# Altium schematic sheet Sensor_Section2.SchDoc
size A
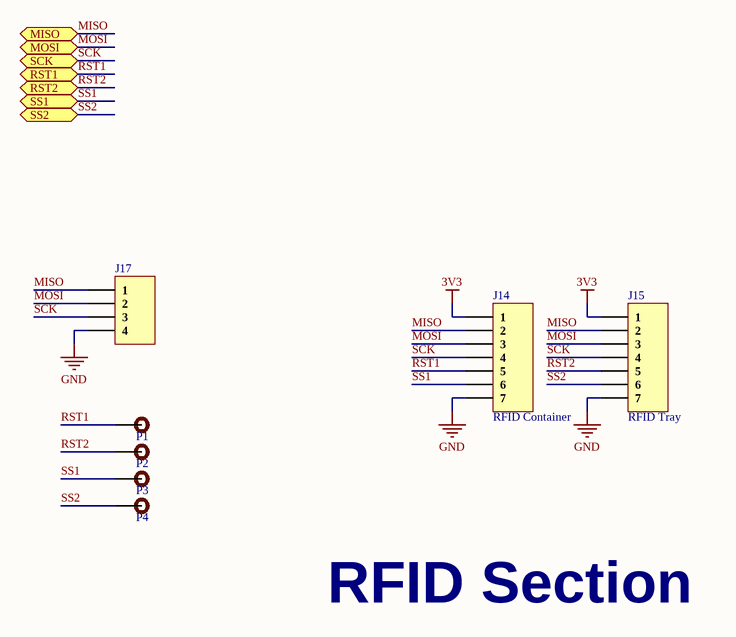
[diagram p0: Sensor_Section2.SchDoc]

## Parts
J14  RFID Container  [B7B-XH-A(LF)(SN)]
J15  RFID Tray  [B7B-XH-A(LF)(SN)]
J17  B4B-XH-A(LF)(SN)  [B4B-XH-A(LF)(SN)]  (value not drawn)
P1  Test Point  [Test point]  (value not drawn)
P2  Test Point  [Test point]  (value not drawn)
P3  Test Point  [Test point]  (value not drawn)
P4  Test Point  [Test point]  (value not drawn)

## Ports
MISO (bidir), MOSI (bidir), RST1 (bidir), RST2 (bidir), SCK (bidir), SS1 (bidir), SS2 (bidir)

## Nets
3V3: J14.1 J15.1
GND: J14.7 J15.7 J17.4
MISO: J14.2 J15.2 J17.1 ; port MISO
MOSI: J14.3 J15.3 J17.2 ; port MOSI
RST1: J14.5 P1.1 ; port RST1
RST2: J15.5 P2.1 ; port RST2
SCK: J14.4 J15.4 J17.3 ; port SCK
SS1: J14.6 P3.1 ; port SS1
SS2: J15.6 P4.1 ; port SS2

## Notes on the sheet
- RFID Section

## Library data of the parts
J14 J15 = B7B-XH-A(LF)(SN): CONN HEADER VERT 7POS 2.5MM; Manufacturer: JST; Current Rating: 3A; Number of Positions: 7; Contact Resistance: 20mR; Voltage Rating (AC): 250V; Insulation Resistance: 1GR; Wire/Cable Gauge: 22AWG; Supplier 1: Digi-Key; Manufacturer Part Number: B7B-XH-A(LF)(SN); Stock 1: 0; Mount: Through Hole; Contact Plating: Copper,Tin,Lead; Contact Material: Brass; Color: Natural; Housing Color: White; Housing Material: Polyamide; Contact Shape: Square; Insulation Material: Nylon; Insulation Color: Natural; Contact Finish - Mating: TIN; Min Operating Temperature: -25°C; Max Operating Temperature: 85°C; Number of Rows: 1; Packaging: Bulk; Termination: Solder; Connector Type: Header; Series: XH; Contact Type: Male Pin; Voltage Rating: 250V; Max Current Rating: 3A; Fastening Type: Detent; Number of Contacts: 7; Max Voltage Rating (AC): 250V; Orientation: Straight; Length: 19.9mm; Pitch: 2.5mm; Lead Pitch: 2.5mm; Depth: 5.75mm; REACH SVHC: No SVHC; Lead Free: Lead Free; Flammability Rating: UL94 V-0; ComponentLink1URL: https://www.verical.com/server-webapp/html/getDatasheet?partID=440406&src-supplier=Verical; ComponentLink1Description: https://www.verical.com/server-webapp/html/getDatasheet?partID=440406&src-supplier=Verical; Supplier Part Number 1: 455-2252-ND
J17 = B4B-XH-A(LF)(SN): CONN HEADER VERT 4POS 2.5MM; Manufacturer: JST; Current Rating: 3A; Contact Resistance: 20mR; Voltage Rating (AC): 250V; Number of Positions: 4; Insulation Resistance: 1GR; Connector Type: Male Pin; Gender: Male; Wire/Cable Gauge: 22AWG; Supplier 1: Digi-Key; Manufacturer Part Number: B4B-XH-A(LF)(SN); Stock 1: 0; Mount: Through Hole; Contact Material: Brass; Contact Plating: Tin,Copper,Lead; Color: Natural; Housing Color: White; Housing Material: Polyamide; Material: Polyamide; Min Operating Temperature: -25°C; Max Operating Temperature: 85°C; Number of Rows: 1; Max Current Rating: 3A; Package Quantity: 500; Packaging: Bulk; Voltage Rating: 250V; Termination: Press-Fit; Max Voltage Rating (AC): 250V; Max Voltage Rating (DC): 250V; Number of Contacts: 4; Orientation: Straight; Series: XH; Contact Type: Male Pin; Length: 12.4mm; Pitch: 2.5mm; Lead Pitch: 2.5mm; Depth: 5.75mm; REACH SVHC: No SVHC; Lead Free: Lead Free; ComponentLink1URL: http://www.jst-mfg.com/product/pdf/eng/eXH.pdf?src-supplier=Digi-Key; ComponentLink1Description: http://www.jst-mfg.com/product/pdf/eng/eXH.pdf?src-supplier=Digi-Key; ComponentLink2URL: https://www.verical.com/server-webapp/html/getDatasheet?partID=640571&src-supplier=Verical; ComponentLink2Description: https://www.verical.com/server-webapp/html/getDatasheet?partID=640571&src-supplier=Verical; ComponentLink3URL: http://www.jst-mfg.com/product/pdf/eng/eXH.pdf?src-supplier=Future+Electronics; ComponentLink3Description: http://www.jst-mfg.com/product/pdf/eng/eXH.pdf?src-supplier=Future+Electronics; ComponentLink4URL: https://www.verical.com/server-webapp/html/getDatasheet?partID=455616&src-supplier=Verical; ComponentLink4Description: https://www.verical.com/server-webapp/html/getDatasheet?partID=455616&src-supplier=Verical; Supplier Part Number 1: 455-2249-ND
P1-P4 = TEST POINT: Test Point ON